# Altium project ESP32IOTProduct.PrjPcb (part 6 of 6)

## Sheet GSM_Sheet.SchDoc
size 420 x 297 mm; DocumentNumber: 5; SheetNumber: 5; SheetTotal: 10
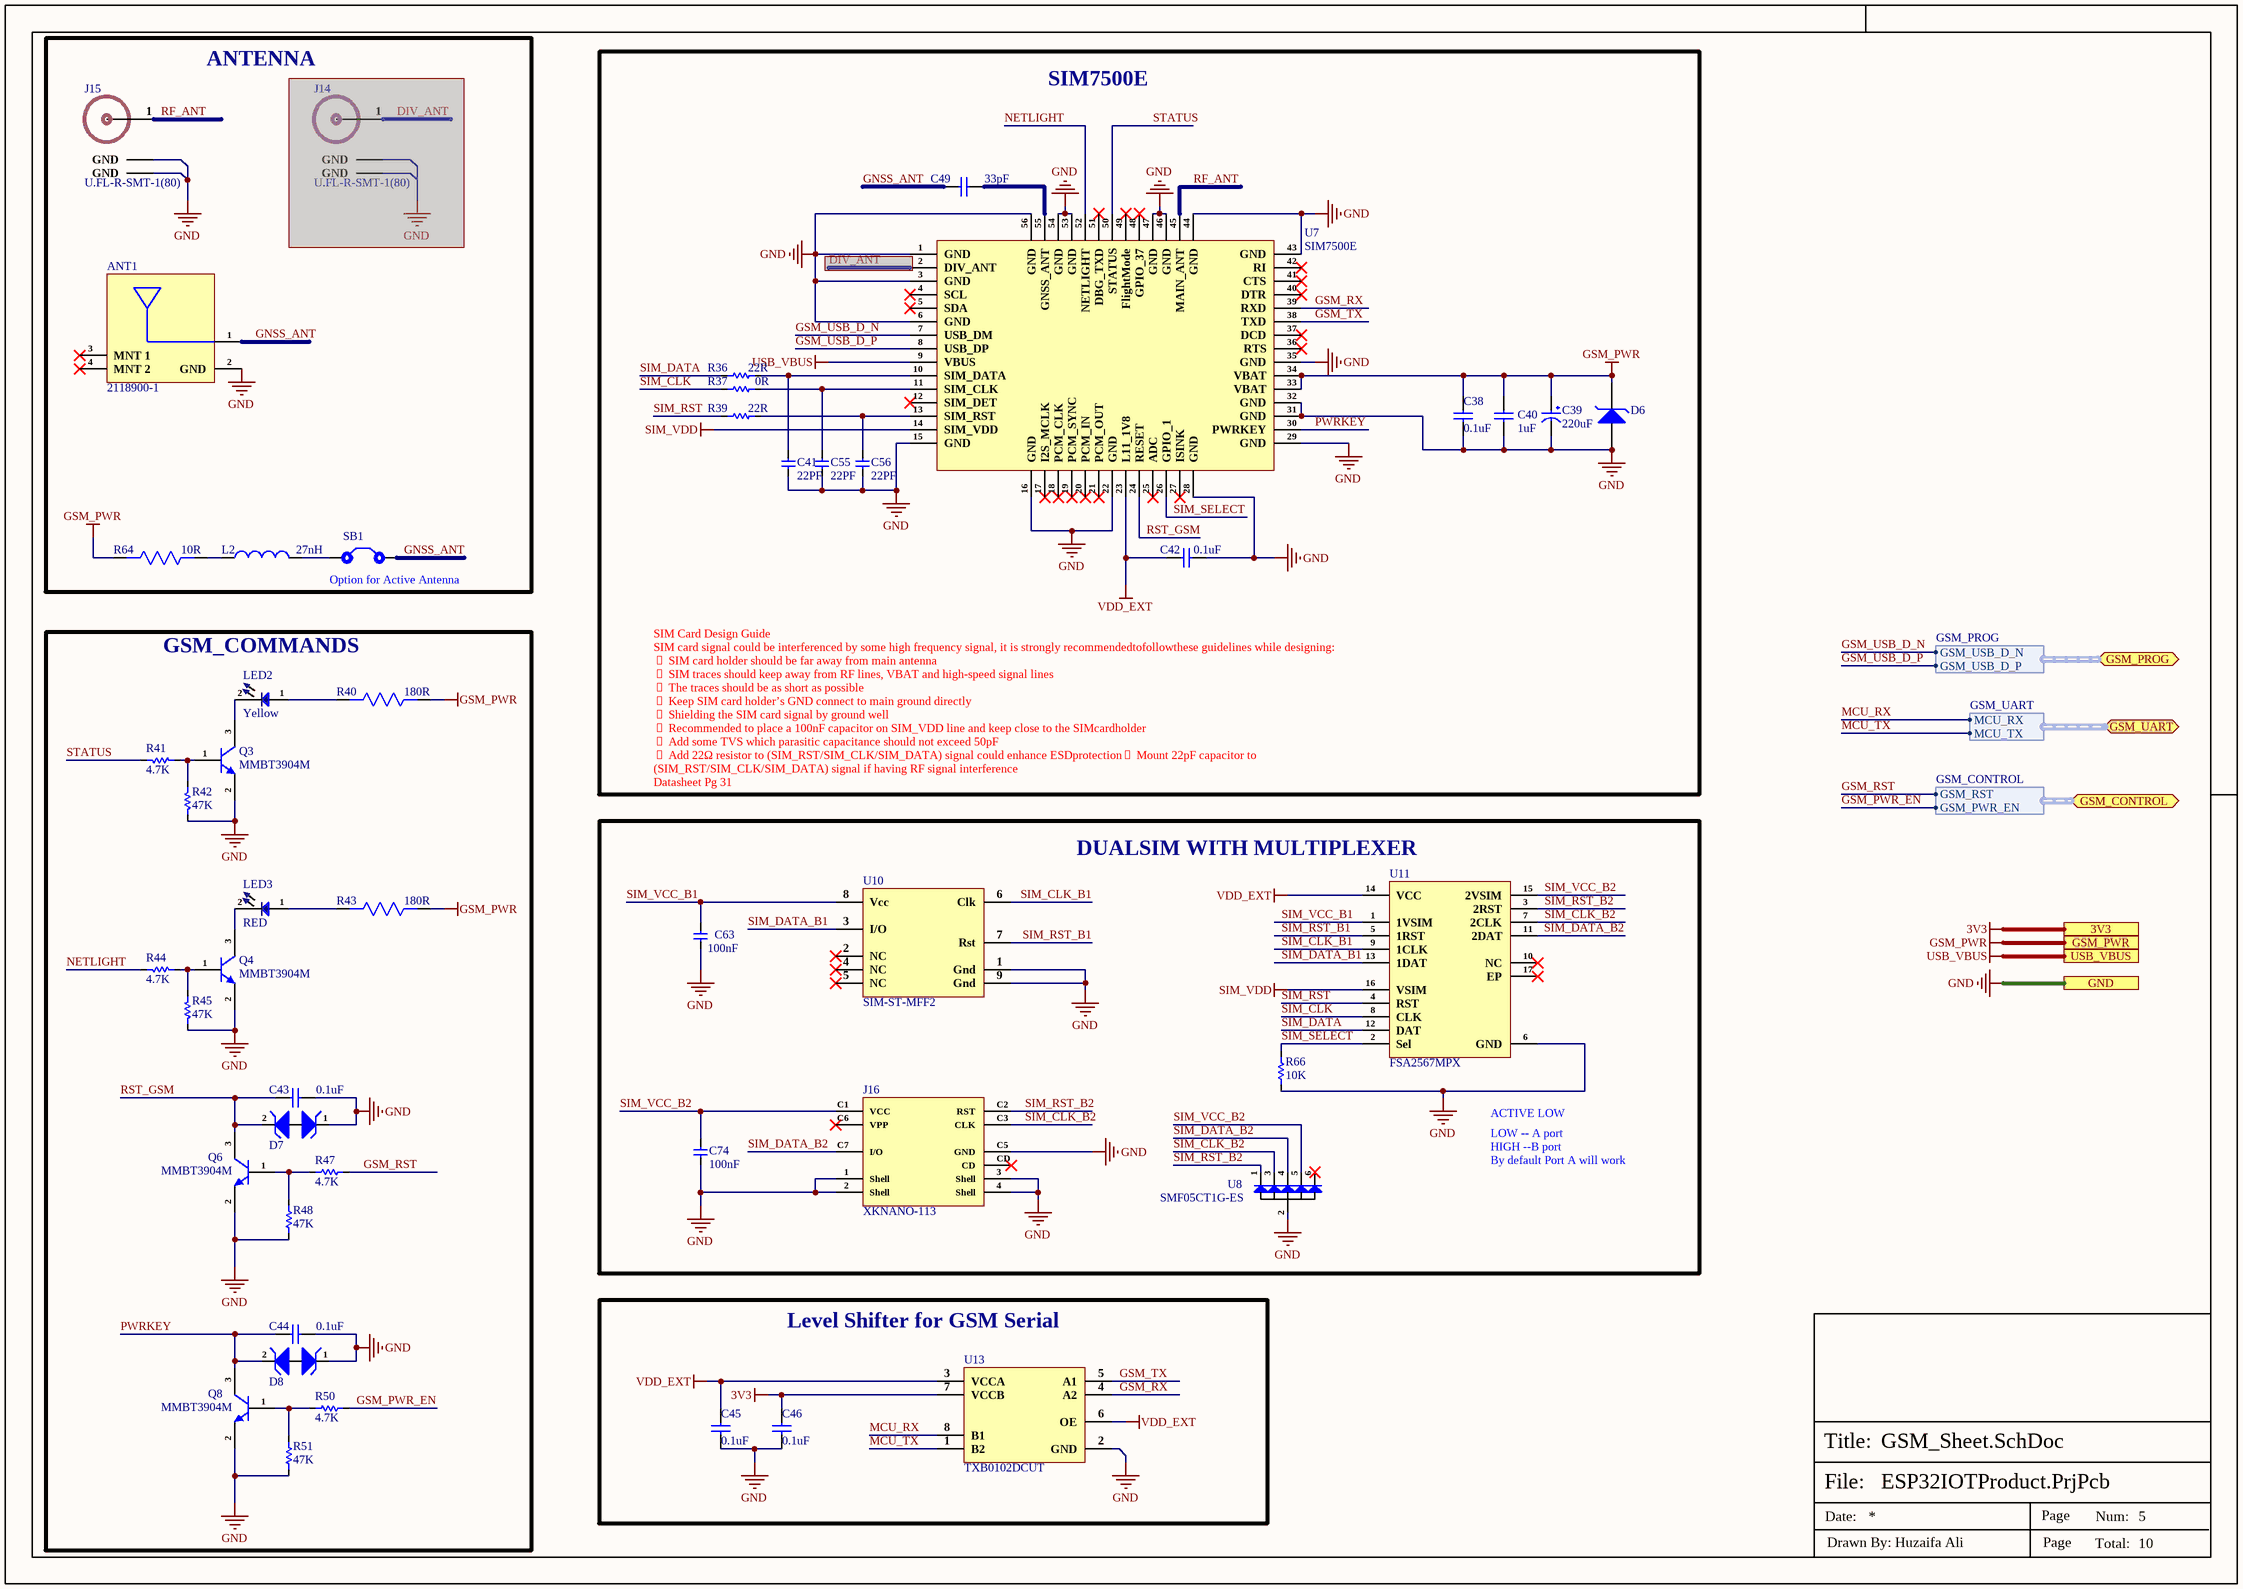
[diagram p9: GSM_Sheet.SchDoc]

### Parts
(Parts that share a designator on the sheet are numbered #1, #2 ... from top to bottom, then left to right.)
ANT1  2118900-1  [2118900-1]
C38  0.1uF  [Cap-0603]
C39  220uF  [UCD-220uF-10mmDia]
C40  1uF  [Cap-0603]
C41  22PF  [Cap-0402]
C42  0.1uF  [Cap-0603]
C43  0.1uF  [Cap-0603]
C44  0.1uF  [Cap-0603]
C45  0.1uF  [Cap-0603]
C46  0.1uF  [Cap-0603]
C49  33pF  [Cap-0402]
C55#2  22PF  [Cap-0402]
C56#2  22PF  [Cap-0402]
C63#2  100nF  [cap-0402]
C74  100nF  [cap-0402]
D6  MMSZ5231BT1G  [SOD-123]  (value not drawn)
D7  ESD5651N-2/TR  [DFN1006-2L_]  (value not drawn)
D8  ESD5651N-2/TR  [DFN1006-2L_]  (value not drawn)
J14  U.FL-R-SMT-1(80)  [U.FL-R-SMT-1(80)_]  (masked out: inside a compile mask, not in the netlist)
J15  U.FL-R-SMT-1(80)  [U.FL-R-SMT-1(80)_]
J16  XKNANO-113  [XKNANO-113]
L2  27nH  [IND-0603 (1608 Metric)]
LED2  Yellow  [LED-0603]
LED3  RED  [LED-0603]
Q3  MMBT3904M  [SOT-723]
Q4  MMBT3904M  [SOT-723]
Q6  MMBT3904M  [SOT-723]
Q8  MMBT3904M  [SOT-723]
R36  22R  [Res-0603]
R37  0R  [Res-0603]
R39  22R  [Res-0603]
R40  180R  [Res-0603]
R41  4.7K  [Res-0603]
R42  47K  [Res-0603]
R43  180R  [Res-0603]
R44  4.7K  [Res-0603]
R45  47K  [Res-0603]
R47  4.7K  [Res-0603]
R48  47K  [Res-0603]
R50  4.7K  [Res-0603]
R51  47K  [Res-0603]
R64  10R  [Res-0603]
R66  10K  [Res-0603]
SB1  Solder Bridge 0603  [Solder Bridge]  (value not drawn)
U7  SIM7500E  [SIM7500E]
U8  SMF05CT1G-ES  [SOT-363]
U10  SIM-ST-MFF2  [QNF8 (6 x 5mm)]
U11  FSA2567MPX  [16-MLP (3x3)]
U13  TXB0102DCUT  [VSSOP-8(2x2.3x0.5)]

### Blocks framed on the sheet
ANTENNA: ANT1 J14 J15 L2 R64 SB1
SIM7500E: C38-C42 C49 C55#2 C56#2 D6 R36 R37 R39 U7
GSM_COMMANDS: C43 C44 D7 D8 LED2 LED3 Q3 Q4 Q6 Q8 R40-R45 R47 R48 R50 R51
DUALSIM WITH MULTIPLEXER: C63#2 C74 J16 R66 U8 U10 U11
Level Shifter for GSM Serial: C45 C46 U13

### Ports
3V3, GND, GSM_CONTROL (bidir, harness GSM_CONTROL), GSM_PROG (bidir, harness GSM_PROG), GSM_PWR, GSM_UART (bidir, harness GSM_UART), USB_VBUS

### Harnesses
GSM_PROG: GSM_USB_D_N, GSM_USB_D_P
GSM_UART: MCU_RX, MCU_TX
GSM_CONTROL: GSM_RST, GSM_PWR_EN

### Nets
3V3: C46.2 U13.7(VCCB) ; port 3V3
GND: ANT1.2(GND) C38.1 C39.2 C40.2 C41.1 C42.1 C43.1 C44.1 C45.1 C46.1 C55#2.1 C56#2.1 C63#2.1 C74.1 D6.1(A) D7.1 D8.1 J15.2(GND) J15.3(GND) J16.1(Shell) J16.2(Shell) J16.3(Shell) J16.4(Shell) J16.C5(GND) Q3.2(E) Q4.2(E) Q6.2(E) Q8.2(E) R42.1 R45.1 R48.1 R51.1 R66.2 U7.1(GND) U7.3(GND) U7.6(GND) U7.15(GND) U7.16(GND) U7.22(GND) U7.28(GND) U7.29(GND) U7.31(GND) U7.32(GND) U7.35(GND) U7.43(GND) U7.44(GND) U7.46(GND) U7.47(GND) U7.53(GND) U7.54(GND) U7.56(GND) U8.2(A) U10.1(Gnd) U10.9(Gnd) U11.6(GND) U13.2(GND) ; port GND
GSM_PWR: C38.2 C39.1 C40.1 D6.2(K) R40.1 R43.1 R64.2 U7.33(VBAT) U7.34(VBAT) ; port GSM_PWR
SIM_VDD: U7.14(SIM_VDD) U11.16(VSIM)
USB_VBUS: U7.9(VBUS) ; port USB_VBUS
VDD_EXT: C42.2 C45.2 U7.23(L11_1V8) U11.14(VCC) U13.3(VCCA) U13.6(OE)
GNSS_ANT: ANT1.1 C49.2 SB1.2
GSM_PWR_EN: R50.1 ; port GSM_CONTROL.GSM_PWR_EN
GSM_RST: R47.1 ; port GSM_CONTROL.GSM_RST
GSM_RX: U7.39(RXD) U13.4(A2)
GSM_TX: U7.38(TXD) U13.5(A1)
GSM_USB_D_N: U7.7(USB_DM) ; port GSM_PROG.GSM_USB_D_N  [project net GSM_PROG.GSM_USB_D_N]
GSM_USB_D_P: U7.8(USB_DP) ; port GSM_PROG.GSM_USB_D_P  [project net GSM_PROG.GSM_USB_D_P]
MCU_RX: U13.8(B1) ; port GSM_UART.MCU_RX
MCU_TX: U13.1(B2) ; port GSM_UART.MCU_TX
NETLIGHT: R44.1 U7.52(NETLIGHT)
PWRKEY: C44.2 D8.2 Q8.3(C) U7.30(PWRKEY)
RF_ANT: J15.1(RF_IN) U7.45(MAIN_ANT)
RST_GSM: C43.2 D7.2 Q6.3(C) U7.24(RESET)
SIM_CLK: R37.2 U11.8(CLK)
SIM_CLK_B1: U10.6(Clk) U11.9(1CLK)
SIM_CLK_B2: J16.C3(CLK) U8.3(IO2) U11.7(2CLK)
SIM_DATA: R36.1 U11.12(DAT)
SIM_DATA_B1: U10.3(I/O) U11.13(1DAT)
SIM_DATA_B2: J16.C7(I/O) U8.4(IO3) U11.11(2DAT)
SIM_RST: R39.1 U11.4(RST)
SIM_RST_B1: U10.7(Rst) U11.5(1RST)
SIM_RST_B2: J16.C2(RST) U8.1(IO1) U11.3(2RST)
SIM_SELECT: R66.1 U7.26(GPIO_1) U11.2(Sel)
SIM_VCC_B1: C63#2.2 U10.8(Vcc) U11.1(1VSIM)
SIM_VCC_B2: C74.2 J16.C1(VCC) U8.5(IO4) U11.15(2VSIM)
STATUS: R41.1 U7.50(STATUS)
NetC41_2: C41.2 R36.2 U7.10(SIM_DATA)
NetC49_1: C49.1 U7.55(GNSS_ANT)
NetC55#2_2: C55#2.2 R37.1 U7.11(SIM_CLK)
NetC56#2_2: C56#2.2 R39.2 U7.13(SIM_RST)
NetL2_1: L2.1 R64.1
NetL2_2: L2.2 SB1.1
NetLED2_1: LED2.1 R40.2
NetLED2_2: LED2.2 Q3.3(C)
NetLED3_1: LED3.1 R43.2
NetLED3_2: LED3.2 Q4.3(C)
NetQ3_1: Q3.1(B) R41.2 R42.2
NetQ4_1: Q4.1(B) R44.2 R45.2
NetQ6_1: Q6.1(B) R47.2 R48.2
NetQ8_1: Q8.1(B) R50.2 R51.2

Not connected (* = marked no-connect by the designer): ANT1 3(MNT_1)* 4(MNT_2)*; J16 C6(VPP)* CD*; U7 2(DIV_ANT) 4(SCL)* 5(SDA)* 12(SIM_DET)* 17(I2S_MCLK)* 18(PCM_CLK)* 19(PCM_SYNC)* 20(PCM_IN)* 21(PCM_OUT)* 25(ADC)* 27(ISINK)* 36(RTS)* 37(DCD)* 40(DTR)* 41(CTS)* 42(RI)* 48(GPIO_37)* 49(FlightMode)* 51(DBG_TXD)*; U8 6(IO5)*; U10 2(NC)* 4(NC)* 5(NC)*; U11 10(NC)* 17(EP)*

### Notes on the sheet
- (near SB1) Option for Active Antenna
- SIM Card Design Guide
  SIM card signal could be interferenced by some high frequency signal, it is strongly recommendedtofollowthese guidelines while designing:
   SIM card holder should be far away from main antenna
   SIM traces should keep away from RF lines, VBAT and high-speed signal lines
   The traces should be as short as possible
   Keep SIM card holder’s GND connect to main ground directly
   Shielding the SIM card signal by ground well
   Recommended to place a 100nF capacitor on SIM_VDD line and keep close to the SIMcardholder
   Add some TVS which parasitic capacitance should not exceed 50pF
   Add 22Ω resistor to (SIM_RST/SIM_CLK/SIM_DATA) signal could enhance ESDprotection Mount 22pF capacitor to (SIM_RST/SIM_CLK/SIM_DATA) signal if having RF signal interference
  Datasheet Pg 31
- ACTIVE LOW
- LOW -- A port
  HIGH --B port
- By default Port A will work
- File:
- Title:
- Date:
- Page
- Num:
- Total:
- Drawn By: Huzaifa Ali

### Library data of the parts
ANT1 = 2118900-1: Standard GNSS Antenna Linear 50Ohm 1602MHz Surface Mount; Manufacturer: TE Connectivity; VSWR: 2; Number of Bands: 1; Max Power Dissipation: 3W; Supplier 1: Arrow Electronics; Manufacturer Part Number: 2118900-1; RoHS: Yes; Category: RF Antennas; Stock 1: 449; Pricing 1: 1=0.6707, 10=0.6495, 25=0.6314, 100=0.5857, 250=0.5691 (USD); Mounting Technology: Surface Mount; Series: -; RoHS Compliant: Yes; ComponentLink1URL: https://www.te.com/commerce/DocumentDelivery/DDEController?Action=srchrtrv&amp;DocNm=1-1773969-5-GNSS-2118900-1-ant-datasheet&amp;DocType=DS&amp;DocLang=English&src-supplier=Digi-Key; ComponentLink1Description: https://www.te.com/commerce/DocumentDelivery/DDEController?Action=srchrtrv&amp;DocNm=1-1773969-5-GNSS-2118900-1-ant-datasheet&amp;DocType=DS&amp;DocLang=English&src-supplier=Digi-Key; Supplier Part Number 1: 2118900-1; Item Type: Antenna
C38 C42-C46 = CC0603KRX5R9BB104: CAP CER 0.1UF 50V X5R 0603; Manufacturer: Yageo; Capacitance: 100nF; Tolerance: 10%; Item Type: Capacitor; Supplier 1: Digi-Key; Manufacturer Part Number: CC0603KRX5R9BB104; RoHS: Yes; Category: Ceramic Capacitors; Stock 1: 152253; Pricing 1: 1=0.10000, 10=0.05200, 50=0.02820, 100=0.02310, 500=0.01648, 1000=0.01294 (USD); Mount: Surface Mount; Case/Package: 0603; Case Code (Imperial): 0603; Case Code (Metric): 1608; Weight: 7.1E-05oz; Min Operating Temperature: -55°C; Max Operating Temperature: 85°C; Packaging: Tape and Reel; Voltage Rating: 50V; Dielectric: X5R; Termination: SMD/SMT; Voltage Rating (DC): 50V; Package Quantity: 4000; Length: 0.063inch; Width: 0.031inch; Thickness: 0.035inch; Lead Free: Lead Free; Halogen Free: Halogen Free; ComponentLink1URL: http://www.mouser.com/ds/2/447/Yageo_UPY-GP_NP0_16V-to-50V_9-358835.pdf?src-supplier=Mouser; ComponentLink1Description: http://www.mouser.com/ds/2/447/Yageo_UPY-GP_NP0_16V-to-50V_9-358835.pdf?src-supplier=Mouser; ComponentLink2URL: https://www.yageo.com/upload/media/product/productsearch/datasheet/mlcc/UPY-GPHC_X5R_4V-to-50V_26.pdf?src-supplier=Digi-Key; ComponentLink2Description: https://www.yageo.com/upload/media/product/productsearch/datasheet/mlcc/UPY-GPHC_X5R_4V-to-50V_26.pdf?src-supplier=Digi-Key; ComponentLink3URL: http://www.yageo.com/exep/pages/download/literatures/ProductSelectionGuide%202014_Final_2.pdf?src-supplier=Digi-Key; ComponentLink3Description: http://www.yageo.com/exep/pages/download/literatures/ProductSelectionGuide%202014_Final_2.pdf?src-supplier=Digi-Key; Supplier Part Number 1: 311-4046-1-ND; LCSC Part Number: C110022
C39 = UCD1H221MNL1GS: CAP ALUM 220UF 20% 50V SMD; Manufacturer: Nichicon; Ripple Current: 700mA; Impedance: 160mR; Leakage Current: 3uA; Life (Hours): 5000Hour; Dissipation Factor: 0.1%; Item Type: Capacitor; Supplier 1: Digi-Key; Manufacturer Part Number: UCD1H221MNL1GS; RoHS: Yes; Category: Aluminum Electrolytic Capacitors; Pricing 1: 1=0.85000, 10=0.60200, 50=0.45480, 100=0.39620 (USD); Mount: Surface Mount,PCB; Case/Package: Radial; Min Operating Temperature: -55°C; Max Operating Temperature: 105°C; Capacitance: 220uF; Tolerance: 20%; Voltage Rating: 50V; Packaging: Tape and Reel; Package Quantity: 1; Voltage Rating (DC): 50V; Termination: SMD/SMT; Voltage: 50V; Features: General Purpose; Series: CD; Construction: Cylindrical; Diameter: 10mm; Length: 10mm; Height: 10mm; Height - Seated (Max): 0.394inch; Radiation Hardening: No; Lead Free: Lead Free; RoHS Compliant: Yes; ComponentLink1URL: https://datasheet.ciiva.com/11776/0900766b80ebdadd-11776792.pdf?src-supplier=RSComponents; ComponentLink1Description: https://datasheet.ciiva.com/11776/0900766b80ebdadd-11776792.pdf?src-supplier=RSComponents; ComponentLink2URL: https://datasheet.ciiva.com/5362/e-cd-22158-5362489.pdf?src-supplier=Mouser; ComponentLink2Description: https://datasheet.ciiva.com/5362/e-cd-22158-5362489.pdf?src-supplier=Mouser; ComponentLink3URL: https://datasheet.ciiva.com/11684/e-cd-11684678.pdf?src-supplier=Avnet; ComponentLink3Description: https://datasheet.ciiva.com/11684/e-cd-11684678.pdf?src-supplier=Avnet; ComponentLink4URL: https://datasheet.ciiva.com/15037/e-cd-15037119.pdf?src-supplier=Digi-Key; ComponentLink4Description: https://datasheet.ciiva.com/15037/e-cd-15037119.pdf?src-supplier=Digi-Key; ComponentLink5URL: https://datasheet.ciiva.com/16393/e-cd-16393493.pdf?src-supplier=Future+Electronics; ComponentLink5Description: https://datasheet.ciiva.com/16393/e-cd-16393493.pdf?src-supplier=Future+Electronics; ComponentLink6URL: https://datasheet.ciiva.com/17354/e-cd-17354606.pdf?src-supplier=Avnet+Europe; ComponentLink6Description: https://datasheet.ciiva.com/17354/e-cd-17354606.pdf?src-supplier=Avnet+Europe; Supplier Part Number 1: 493-6390-1-ND; LCSC Part Number: C116211
C40 = CC0603KRX5R8BB105: CAP CER 1UF 25V X5R 0603; Manufacturer: Yageo; Tolerance: 10%; Supplier 1: Digi-Key; Manufacturer Part Number: CC0603KRX5R8BB105; RoHS: Yes; Category: Ceramic Capacitors; Stock 1: 919939; Pricing 1: 1=0.12000, 10=0.08400, 50=0.04760, 100=0.03940, 500=0.02764, 1000=0.02288 (USD); Mount: Surface Mount; Case/Package: 0603; Number of Pins: 2; Case Code (Metric): 1608; Case Code (Imperial): 0603; Min Operating Temperature: -55°C; Max Operating Temperature: 85°C; Capacitance: 1uF; Dielectric: X5R; Package Quantity: 1; Voltage Rating: 25V; Packaging: Tape and Reel; Termination: SMD/SMT; Voltage Rating (DC): 25V; Series: CC; Construction: Flat; Length: 1.6mm; Width: 0.031inch; Height: 0.8mm; Thickness: 0.035inch; Depth: 0.8mm; Radiation Hardening: No; REACH SVHC: No SVHC; Lead Free: Lead Free; Halogen Free: Halogen Free; RoHS Compliant: Yes; ComponentLink1URL: https://datasheet.ciiva.com/176/mlccorderingcode-176785.pdf?src-supplier=Digi-Key; ComponentLink1Description: https://datasheet.ciiva.com/176/mlccorderingcode-176785.pdf?src-supplier=Digi-Key; ComponentLink2URL: https://datasheet.ciiva.com/176/mlccorderingcode-176786.pdf?src-supplier=Digi-Key; ComponentLink2Description: https://datasheet.ciiva.com/176/mlccorderingcode-176786.pdf?src-supplier=Digi-Key; ComponentLink3URL: https://datasheet.ciiva.com/176/mlccorderingcode-176787.pdf?src-supplier=Digi-Key; ComponentLink3Description: https://datasheet.ciiva.com/176/mlccorderingcode-176787.pdf?src-supplier=Digi-Key; ComponentLink4URL: https://datasheet.ciiva.com/17436/upy-gphc-x5r-4v-to-50v-12-17436952.pdf?src-supplier=Avnet+Europe; ComponentLink4Description: https://datasheet.ciiva.com/17436/upy-gphc-x5r-4v-to-50v-12-17436952.pdf?src-supplier=Avnet+Europe; ComponentLink5URL: https://datasheet.ciiva.com/7978/1525783-7978171.pdf?src-supplier=Element14; ComponentLink5Description: https://datasheet.ciiva.com/7978/1525783-7978171.pdf?src-supplier=Element14; ComponentLink6URL: https://datasheet.ciiva.com/11586/upy-gphc-x5r-4v-to-50v-12-11586318.pdf?src-supplier=Avnet; ComponentLink6Description: https://datasheet.ciiva.com/11586/upy-gphc-x5r-4v-to-50v-12-11586318.pdf?src-supplier=Avnet; Supplier Part Number 1: 311-1445-1-ND; LCSC Part Number: C14664
C41 C55#2 C56#2 = CC0402JRNPO9BN220: CAP CER 22PF 50V C0G/NPO 0402; Manufacturer: Yageo; Dielectric Material: Ceramic; Tolerance: 5%; Dielectric: C0G; Temperature Coefficient: 30ppm/°C; Insulation Resistance: 100GR; Item Type: Capacitor; Supplier 1: Future Electronics; Manufacturer Part Number: CC0402JRNPO9BN220; RoHS: Yes; Category: Ceramic Capacitors; Stock 1: 200000; Pricing 1: 10000=0.00220, 40000=0.00210, 150000=0.00200, 400000=0.00190, 1000000=0.00180 (USD); Mounting Technology: Surface Mount; Case/Package: 0402; Pins: 2; Case Code (Metric): 1005; Case Code (Imperial): 0402; Min Operating Temperature: -55°C; Max Operating Temperature: 125°C; Value: 22pF; Voltage Rating: 50V; Packaging: Tape and Reel; Package Quantity: 1; Voltage Rating (DC): 50V; Termination: SMD/SMT; Resistor Type: Ceramic; Voltage: 50V; Series: CC; Length: 1mm; Width: 0.02inch; Height: 0.5mm; Thickness: 0.022inch; Depth: 0.5mm; Radiation Hardening: No; Reach SVHC Compliant: Yes; Lead Free: Lead Free; RoHS Compliant: Yes; ComponentLink1URL: https://datasheet.ciiva.com/5789/1443161-5789509.pdf?src-supplier=Farnell; ComponentLink1Description: https://datasheet.ciiva.com/5789/1443161-5789509.pdf?src-supplier=Farnell; ComponentLink2URL: https://datasheet.ciiva.com/8033/1443161-8033606.pdf?src-supplier=Element14; ComponentLink2Description: https://datasheet.ciiva.com/8033/1443161-8033606.pdf?src-supplier=Element14; ComponentLink3URL: https://datasheet.ciiva.com/7656/1132289-7656615.pdf?src-supplier=Element14; ComponentLink3Description: https://datasheet.ciiva.com/7656/1132289-7656615.pdf?src-supplier=Element14; ComponentLink4URL: https://datasheet.ciiva.com/8033/1443161-8033607.pdf?src-supplier=Element14; ComponentLink4Description: https://datasheet.ciiva.com/8033/1443161-8033607.pdf?src-supplier=Element14; ComponentLink5URL: https://datasheet.ciiva.com/8033/1443161-8033605.pdf?src-supplier=Element14; ComponentLink5Description: https://datasheet.ciiva.com/8033/1443161-8033605.pdf?src-supplier=Element14; ComponentLink6URL: https://datasheet.ciiva.com/143/mlccorderingcode-143987.pdf?src-supplier=Digi-Key; ComponentLink6Description: https://datasheet.ciiva.com/143/mlccorderingcode-143987.pdf?src-supplier=Digi-Key; ComponentLink7URL: https://datasheet.ciiva.com/143/mlccorderingcode-143986.pdf?src-supplier=Digi-Key; ComponentLink7Description: https://datasheet.ciiva.com/143/mlccorderingcode-143986.pdf?src-supplier=Digi-Key; ComponentLink8URL: https://datasheet.ciiva.com/143/mlccorderingcode-143988.pdf?src-supplier=Digi-Key; ComponentLink8Description: https://datasheet.ciiva.com/143/mlccorderingcode-143988.pdf?src-supplier=Digi-Key; ComponentLink9URL: https://datasheet.ciiva.com/5425/upy-gp-np0-16v-to-50v-8-5425483.pdf?src-supplier=Mouser; ComponentLink9Description: https://datasheet.ciiva.com/5425/upy-gp-np0-16v-to-50v-8-5425483.pdf?src-supplier=Mouser; ComponentLink10URL: https://datasheet.ciiva.com/15189/getdatasheetpartid-370074-15189117.pdf?src-supplier=Verical; ComponentLink10Description: https://datasheet.ciiva.com/15189/getdatasheetpartid-370074-15189117.pdf?src-supplier=Verical; Supplier Part Number 1: 9105957; LCSC Part Number: C106203
C49 = GRM1555C1E330JA01D: CAP CER 33PF 25V C0G/NP0 0402; Manufacturer: Murata; Tolerance: 5%; Dielectric: C0G; Supplier 1: Digi-Key; Manufacturer Part Number: GRM1555C1E330JA01D; Stock 1: 250773; Pricing 1: 1=0.1, 10=0.034, 50=0.0184, 100=0.0151, 500=0.01078, 1000=0.00847, 2500=0.0077, 5000=0.00708 (USD); Mount: Surface Mount; Case/Package: 0402; Case Code (Metric): 1005; Case Code (Imperial): 0402; Min Operating Temperature: -55°C; Max Operating Temperature: 125°C; Capacitance: 33pF; Package Quantity: 1; Voltage Rating: 25V; Packaging: Tape and Reel; Voltage Rating (DC): 25V; Termination: SMD/SMT; Voltage: 25V; Series: GRM; Construction: Flat; Length: 1mm; Width: 0.02inch; Height: 0.5mm; Thickness: 0.022inch; Depth: 0.5mm; Radiation Hardening: No; Lead Free: Lead Free; RoHS Compliant: Yes; ComponentLink1URL: https://www.murata.com/~/media/webrenewal/support/library/catalog/products/capacitor/mlcc/c02e.ashx?la=en-us&src-supplier=Digi-Key; ComponentLink1Description: https://www.murata.com/~/media/webrenewal/support/library/catalog/products/capacitor/mlcc/c02e.ashx?la=en-us&src-supplier=Digi-Key; ComponentLink2URL: http://www.mouser.com/ds/2/281/c02e-2905.pdf?src-supplier=Mouser; ComponentLink2Description: http://www.mouser.com/ds/2/281/c02e-2905.pdf?src-supplier=Mouser; ComponentLink3URL: http://psearch.murata.com/capacitor/product/GRM1555C1E330JA01%23.pdf?src-supplier=Avnet; ComponentLink3Description: http://psearch.murata.com/capacitor/product/GRM1555C1E330JA01%23.pdf?src-supplier=Avnet; Supplier Part Number 1: 490-6177-1-ND; LCSC Part Number: C441758
C63#2 C74 = C1005X7R1H104KT000F: CAP CER 0.1UF 50V X7R 0402; Manufacturer: TDK; Tolerance: 10%; Voltage: 25V; Item Type: Capacitor; Supplier 1: Avnet; Manufacturer Part Number: C1005X7R1H104KT000F; RoHS: No; Category: Ceramic Capacitors; Dielectric: X7R; Supplier Part Number 1: C1005X7R1H104KT000F; LCSC Part Number: C361198; ComponentLink1Description: LCSC; ComponentLink1URL: https://www.lcsc.com/product-detail/Multilayer-Ceramic-Capacitors-MLCC-SMD-SMT_TDK-C1005X7R1H104KT000F_C361198.html
D6 = MMSZ5231BT1G: DIODE ZENER 5.1V 500MW SOD123; Manufacturer: ON Semiconductor; Material: Plastic; Max Reverse Leakage Current: 5uA; Impedance: 17R; Tolerance: 5%; Zener Current: 10mA; Test Current: 20mA; Forward Voltage: 900mV; Breakdown Voltage: 5.36V; Supplier 1: Allied Electronics; Manufacturer Part Number: MMSZ5231BT1G; RoHS: Yes; Category: Zener Diodes; Case/Package: SOD-123-2; Pins: 2; Min Operating Temperature: -55°C; Max Operating Temperature: 150°C; Max Power Dissipation: 500mW; Packaging: Tape and Reel; Zener Voltage: 5.1V; Package Quantity: 3000; Series: Automotive, AEC-Q101; Voltage Tolerance: 5%; Power Dissipation: 500mW; Working Voltage: 5.1V; Max Reverse Current: 5uA; Voltage Rating (DC): 5.1V; Power Rating: 500mW; Length: 2.69mm; Width: 1.6mm; Height: 1.12mm; RoHS Compliant: Yes; Lead Free: Lead Free; Reach SVHC Compliant: No; ComponentLink1URL: https://datasheet.ciiva.com/23815/1708301-23815376.pdf?src-supplier=Newark; ComponentLink1Description: https://datasheet.ciiva.com/23815/1708301-23815376.pdf?src-supplier=Newark; ComponentLink2URL: https://datasheet.ciiva.com/22626/1708301-22626967.pdf?src-supplier=Element14; ComponentLink2Description: https://datasheet.ciiva.com/22626/1708301-22626967.pdf?src-supplier=Element14; ComponentLink3URL: https://datasheet.ciiva.com/4731/mmsz5221bt1-d-4731452.pdf?src-supplier=Mouser; ComponentLink3Description: https://datasheet.ciiva.com/4731/mmsz5221bt1-d-4731452.pdf?src-supplier=Mouser; ComponentLink4URL: https://datasheet.ciiva.com/16200/mmsz5221bt1-d-16200104.pdf?src-supplier=Future+Electronics; ComponentLink4Description: https://datasheet.ciiva.com/16200/mmsz5221bt1-d-16200104.pdf?src-supplier=Future+Electronics; ComponentLink5URL: https://datasheet.ciiva.com/894/mmsz5221bt1-d-894882.pdf?src-supplier=Digi-Key; ComponentLink5Description: https://datasheet.ciiva.com/894/mmsz5221bt1-d-894882.pdf?src-supplier=Digi-Key; ComponentLink6URL: https://datasheet.ciiva.com/894/mmsz5221bt1-d-894883.pdf?src-supplier=Digi-Key; ComponentLink6Description: https://datasheet.ciiva.com/894/mmsz5221bt1-d-894883.pdf?src-supplier=Digi-Key; ComponentLink7URL: https://datasheet.ciiva.com/894/mmsz5221bt1-d-894881.pdf?src-supplier=Digi-Key; ComponentLink7Description: https://datasheet.ciiva.com/894/mmsz5221bt1-d-894881.pdf?src-supplier=Digi-Key; Supplier Part Number 1: 70099546; LCSC Part Number: C66198; Item Type: Diode
D7 D8 = ESD5651N-2/TR: 35A@8/20us 15V 4.5V@Max Unidirectional DFN1006 TVS ROHS; Manufacturer: WILLSEMI(Will Semicon); Item Type: Diode; Manufacturer Part Number: ESD5651N-2/TR; Package: DFN1006; LCSC Part Number: C239784; ComponentLink1Description: LCSC; ComponentLink1URL: https://www.lcsc.com/product-detail/TVS_WILLSEMI-Will-Semicon-ESD5651N-2-TR_C239784.html
J14 J15 = U.FL-R-SMT-1(80): CONN U.FL RCPT STR 50 OHM SMD; Manufacturer: Hirose; Supplier 1: Future Electronics; Manufacturer Part Number: U.FL-R-SMT-1(80); Stock 1: 1272; Pricing 1: 1=1.07, 500=0.785, 1500=0.74, 2500=0.72, 5000=0.695 (USD); Case/Package: SMD/SMT; Package Quantity: 10000; Packaging: Tape and Reel; Lead Free: Lead Free; ComponentLink1URL: https://www.hirose.com/product/en/download_file/key_name/U.FL-R-SMT-1%2880%29/category/Specification%20Sheet/doc_file_id/37638/?file_category_id=9&item_id=03310472280&is_series=&src-supplier=Digi-Key; ComponentLink1Description: https://www.hirose.com/product/en/download_file/key_name/U.FL-R-SMT-1%2880%29/category/Specification%20Sheet/doc_file_id/37638/?file_category_id=9&item_id=03310472280&is_series=&src-supplier=Digi-Key; ComponentLink2URL: http://www.mouser.com/ds/2/185/U.FL_catalog-939761.pdf?src-supplier=Mouser; ComponentLink2Description: http://www.mouser.com/ds/2/185/U.FL_catalog-939761.pdf?src-supplier=Mouser; Supplier Part Number 1: U.FL-R-SMT-1(80)-CUTT; LCSC Part Number: C88374
J16 = XKNANO-113: Copper Alloy Self bomb Gold plating 1.25mm Deck -40℃~+85℃ 260℃ NanoSIM SMD SIM Card Connectors ROHS; Manufacturer: XKB Connectivity; Manufacturer Part Number: XKNANO-113; Package: SMD Custom; LCSC Part Number: C381071; Item Type: SIM Card Connectors; ComponentLink1Description: LCSC; ComponentLink1URL: https://www.lcsc.com/product-detail/SIM-Card-Connectors_XKB-Connectivity-XKNANO-113_C381071.html
L2 = LQW18AN27NG10D: FIXED IND 27NH 590MA 116MOHM SMD; Manufacturer: Murata; Core Material: Non-Magnetic; Tolerance: 2%; DC Resistance (DCR): 116mR; Shielding: Unshielded; Self Resonant Frequency: 2.8GHz; Q Factor: 42; Test Frequency: 100MHz; Item Type: Inductor; Supplier 1: Arrow Electronics; Manufacturer Part Number: LQW18AN27NG10D; RoHS: Yes; Category: Fixed Inductors; Stock 1: 3528; Pricing 1: 1=0.17550, 10=0.13260, 25=0.13120, 100=0.10470, 250=0.09530, 500=0.08580, 1000=0.07160, 3000=0.06500 (USD); Mount: Surface Mount; Case/Package: 0603; Weight: 0.000106oz; Case Code (Metric): 1608; Case Code (Imperial): 0603; Min Operating Temperature: -55°C; Max Operating Temperature: 125°C; Inductance: 27nH; Packaging: Tape and Reel; Max DC Current: 590mA; Inductance Tolerance: 2%; Package Quantity: 1; Current Rating: 590mA; Resistor Type: Wirewound; Termination: SMD/SMT; DC Current: 590mA; Series: LQW18A_10; Length: 1.6mm; Width: 0.031inch; Height: 0.8mm; Depth: 1.1mm; Height - Seated (Max): 0.039inch; Radiation Hardening: No; Lead Free: Lead Free; Military Standard: Not; Reach SVHC Compliant: Yes; RoHS Compliant: Yes; ComponentLink1URL: https://datasheet.ciiva.com/11799/0900766b80a002db-11799175.pdf?src-supplier=RSComponents; ComponentLink1Description: https://datasheet.ciiva.com/11799/0900766b80a002db-11799175.pdf?src-supplier=RSComponents; ComponentLink2URL: https://datasheet.ciiva.com/6705/l0075s0080lqw18a-10-6705574.pdf?src-supplier=Digi-Key; ComponentLink2Description: https://datasheet.ciiva.com/6705/l0075s0080lqw18a-10-6705574.pdf?src-supplier=Digi-Key; ComponentLink3URL: https://datasheet.ciiva.com/8507/l0075s0080lqw18a-10-8507510.pdf?src-supplier=Avnet; ComponentLink3Description: https://datasheet.ciiva.com/8507/l0075s0080lqw18a-10-8507510.pdf?src-supplier=Avnet; ComponentLink4URL: https://datasheet.ciiva.com/4978/product-4978252.pdf?src-supplier=Mouser; ComponentLink4Description: https://datasheet.ciiva.com/4978/product-4978252.pdf?src-supplier=Mouser; Supplier Part Number 1: LQW18AN27NG10D; LCSC Part Number: C701182
LED2 = 19-21/G6C-FM1N2B/3T: Yellow-Green 572nm LED Indication - Discrete 2.05V 0603 (1608 Metric); Manufacturer: Everlight Elec; Manufacturer Part Number: 19-21/G6C-FM1N2B/3T; Package: 0603; LCSC Part Number: C93689; Item Type: LED; ComponentLink1Description: LCSC; ComponentLink1URL: https://www.lcsc.com/product-detail/Light-Emitting-Diodes-LED_Everlight-Elec-19-21-G6C-FM1N2B-3T_C93689.html
LED3 = 19-21/R7C-AK1L2BY/3T: Red 632nm LED Indication - Discrete 2.05V 0603 (1608 Metric); Manufacturer: Everlight Elec; Manufacturer Part Number: 19-21/R7C-AK1L2BY/3T; Package: 0603; LCSC Part Number: C1322287; Item Type: LED; ComponentLink1Description: LCSC; ComponentLink1URL: https://www.lcsc.com/product-detail/Light-Emitting-Diodes-LED_Everlight-Elec-19-21-R7C-AK1L2BY-3T_C1322287.html
Q3 Q4 Q6 Q8 = MMBT3904M: 40V 100mW 100@10mA,1V 200mA 300MHz 300mV@50mA,5mA NPN -55℃~+150℃@(Tj) SOT-723 Bipolar Transistors - BJT ROHS; Manufacturer: TECH PUBLIC; Item Type: Mosfet; ComponentLink1Description: LCSC; ComponentLink1URL: https://www.lcsc.com/product-detail/Bipolar-Transistors-BJT_TECH-PUBLIC-MMBT3904M_C2923360.html; Manufacturer Part Number: MMBT3904M; Package: SOT-723; LCSC Part Number: C2923360
R36 R39 = RC0603FR-0722RL: RES 22 OHM 1% 1/10W 0603; Manufacturer: Yageo; Temperature Coefficient: 100ppm/°C; Voltage Rating (DC): 50V; Power Rating: 100mW; Item Type: Resistor; Supplier 1: Avnet; Manufacturer Part Number: RC0603FR-0722RL; RoHS: Yes; Category: Chip SMD Resistors; Stock 1: 190000; Pricing 1: 5000=0.00133, 10000=0.00131, 20000=0.00127 (USD); Case/Package: 0603; Number of Pins: 2; Case Code (Metric): 1608; Case Code (Imperial): 0603; Size Code: 0603; Min Operating Temperature: -55°C; Max Operating Temperature: 155°C; Tolerance: 1%; Resistance: 22R; Resistor Type: Thick Film; Packaging: Tape and Reel; Voltage Rating: 50V; Package Quantity: 1; Number of Terminations: 2; Termination: SMD/SMT; Max Power Dissipation: 100mW; Features: Moisture Resistant; Series: RC; Resistance Tolerance: 1%; Technology: THICK FILM; Construction: Rectangular; Length: 0.063inch; Width: 0.031inch; Height: 0.022inch; Depth: 0.8mm; Reach SVHC Compliant: Yes; Lead Free: Lead Free; Military Standard: Not; RoHS Compliant: Yes; ComponentLink1URL: https://datasheet.ciiva.com/11819/0900766b80f96399-11819285.pdf?src-supplier=RSComponents; ComponentLink1Description: https://datasheet.ciiva.com/11819/0900766b80f96399-11819285.pdf?src-supplier=RSComponents; ComponentLink2URL: https://datasheet.ciiva.com/46395/443971-46395032.pdf?src-supplier=Element14; ComponentLink2Description: https://datasheet.ciiva.com/46395/443971-46395032.pdf?src-supplier=Element14; ComponentLink3URL: https://datasheet.ciiva.com/46440/1868787-46440901.pdf?src-supplier=Element14; ComponentLink3Description: https://datasheet.ciiva.com/46440/1868787-46440901.pdf?src-supplier=Element14; ComponentLink4URL: https://datasheet.ciiva.com/2454/pyu-r-int-thick-7-2454355.pdf?src-supplier=Digi-Key; ComponentLink4Description: https://datasheet.ciiva.com/2454/pyu-r-int-thick-7-2454355.pdf?src-supplier=Digi-Key; ComponentLink5URL: https://datasheet.ciiva.com/2454/pyu-r-int-thick-7-2454356.pdf?src-supplier=Digi-Key; ComponentLink5Description: https://datasheet.ciiva.com/2454/pyu-r-int-thick-7-2454356.pdf?src-supplier=Digi-Key; ComponentLink6URL: https://datasheet.ciiva.com/2454/pyu-r-int-thick-7-2454354.pdf?src-supplier=Digi-Key; ComponentLink6Description: https://datasheet.ciiva.com/2454/pyu-r-int-thick-7-2454354.pdf?src-supplier=Digi-Key; Supplier Part Number 1: RC0603FR-0722RL; LCSC Part Number: C107701
R37 = RC0603FR-070RL: RES SMD 0R, 1%, 0.1W, 0603; Manufacturer: Yageo; Item Type: Resistor; Manufacturer Part Number: RC0603FR-070RL; Package: 0603; LCSC Part Number: C100044; ComponentLink9Description: LCSC; ComponentLink9URL: https://www.lcsc.com/product-detail/Chip-Resistor-Surface-Mount_YAGEO-RC0603FR-070RL_C100044.html
R40 R43 = RC0603FR-07180RL: RES 180 OHM 1% 1/10W 0603; Manufacturer: Yageo; Power Rating: 100mW; Voltage Rating (DC): 50V; Temperature Coefficient: 100ppm/°C; Item Type: Resistor; Supplier 1: Avnet; Manufacturer Part Number: RC0603FR-07180RL; RoHS: Yes; Category: Chip SMD Resistors; Stock 1: 35000; Pricing 1: 5000=0.00133, 10000=0.00131, 20000=0.00127 (USD); Case/Package: 0603; Number of Pins: 2; Case Code (Metric): 1608; Case Code (Imperial): 0603; Size Code: 0603; Min Operating Temperature: -55°C; Max Operating Temperature: 155°C; Tolerance: 1%; Resistance: 180R; Packaging: Tape and Reel; Package Quantity: 1; Voltage Rating: 50V; Resistor Type: Thick Film; Number of Terminations: 2; Termination: SMD/SMT; Max Power Dissipation: 100mW; Features: Moisture Resistant; Series: RC; Construction: Rectangular; Resistance Tolerance: 1%; Length: 1.6mm; Width: 0.8mm; Height: 0.022inch; Depth: 0.8mm; Lead Free: Lead Free; Military Standard: Not; RoHS Compliant: Yes; ComponentLink1URL: https://datasheet.ciiva.com/2454/pyu-r-int-thick-7-2454469.pdf?src-supplier=Digi-Key; ComponentLink1Description: https://datasheet.ciiva.com/2454/pyu-r-int-thick-7-2454469.pdf?src-supplier=Digi-Key; ComponentLink2URL: https://datasheet.ciiva.com/2454/pyu-r-int-thick-7-2454470.pdf?src-supplier=Digi-Key; ComponentLink2Description: https://datasheet.ciiva.com/2454/pyu-r-int-thick-7-2454470.pdf?src-supplier=Digi-Key; ComponentLink3URL: https://datasheet.ciiva.com/2454/pyu-r-int-thick-7-2454468.pdf?src-supplier=Digi-Key; ComponentLink3Description: https://datasheet.ciiva.com/2454/pyu-r-int-thick-7-2454468.pdf?src-supplier=Digi-Key; ComponentLink4URL: https://datasheet.ciiva.com/7746/443971-7746267.pdf?src-supplier=Element14; ComponentLink4Description: https://datasheet.ciiva.com/7746/443971-7746267.pdf?src-supplier=Element14; ComponentLink5URL: https://datasheet.ciiva.com/7746/443971-7746266.pdf?src-supplier=Element14; ComponentLink5Description: https://datasheet.ciiva.com/7746/443971-7746266.pdf?src-supplier=Element14; ComponentLink6URL: https://datasheet.ciiva.com/15189/getdatasheetpartid-325160-15189622.pdf?src-supplier=Verical; ComponentLink6Description: https://datasheet.ciiva.com/15189/getdatasheetpartid-325160-15189622.pdf?src-supplier=Verical; Supplier Part Number 1: RC0603FR-07180RL; LCSC Part Number: C137786
R41 R44 R47 R50 = RC0603JR-074K7L: RES SMD 4.7K OHM 5% 1/10W 0603; Manufacturer: Yageo; Resistance: 4.7kR; Temperature Coefficient: 100ppm/°C; Voltage Rating (DC): 50V; Power Rating: 100mW; Item Type: Resistor; Supplier 1: Digi-Key; Manufacturer Part Number: RC0603JR-074K7L; Stock 1: 19706643; Pricing 1: 1=0.1, 10=0.02, 100=0.0081, 1000=0.00362, 2500=0.00314 (USD); Case/Package: 0603; Number of Pins: 2; Case Code (Imperial): 0603; Case Code (Metric): 1608; Min Operating Temperature: -55°C; Max Operating Temperature: 155°C; Tolerance: 5%; Composition: Thick Film; Packaging: Tape and Reel; Voltage Rating: 50V; Termination: SMD/SMT; Military Standard: Not; Length: 1.6mm; Width: 0.8mm; Depth: 0.8mm; REACH SVHC: No SVHC; Lead Free: Lead Free; ComponentLink1URL: http://www.farnell.com/datasheets/443971.pdf?src-supplier=Element14; ComponentLink1Description: http://www.farnell.com/datasheets/443971.pdf?src-supplier=Element14; Supplier Part Number 1: 311-4.7KGRCT-ND; LCSC Part Number: C105428
R42 R45 R48 R51 = RC0603JR-0747KL: RES 47K OHM 5% 1/10W 0603; Manufacturer: Yageo; Resistance: 47kR; Power Rating: 100mW; Voltage Rating (DC): 50V; Temperature Coefficient: 100ppm/°C; Resistance Tolerance: 1%; Supplier 1: Arrow; Manufacturer Part Number: RC0603JR-0747KL; Stock 1: 599135; Pricing 1: 5000=0.0025, 10000=0.0022, 25000=0.0019, 1=0.0011, 6000=0.001 (USD); Case/Package: 0603; Number of Pins: 2; Case Code (Imperial): 0603; Case Code (Metric): 1608; Min Operating Temperature: -55°C; Max Operating Temperature: 155°C; Packaging: Tape and Reel; Tolerance: 5%; Voltage Rating: 50V; Package Quantity: 5000; Termination: SMD/SMT; Military Standard: Not; Composition: Thick Film; Length: 1.6mm; Height: 0.45mm; Width: 0.8mm; Depth: 0.8mm; REACH SVHC: No SVHC; Lead Free: Lead Free; ComponentLink1URL: http://www.farnell.com/datasheets/443971.pdf; ComponentLink1Description: http://www.farnell.com/datasheets/443971.pdf; ComponentLink2URL: http://www.mouser.com/catalog/specsheets/RC0603.pdf; ComponentLink2Description: http://www.mouser.com/catalog/specsheets/RC0603.pdf; Supplier Part Number 1: RC0603JR-0747KL; Supplier 2: Digi-Key; RoHS: Yes; Category: Chip SMD Resistors; Stock 2: 1087850; Pricing 2: 1=0.10000, 10=0.02300, 100=0.00930, 1000=0.00417, 2500=0.00362 (USD); Size Code: 0603; Number of Terminations: 2; Resistor Type: Thick Film; Features: Moisture Resistant; Series: RC; Max Power Dissipation: 100mW; Construction: Rectangular; RoHS Compliant: Yes; ComponentLink3URL: https://datasheet.ciiva.com/46395/443971-46395003.pdf?src-supplier=Element14; ComponentLink3Description: https://datasheet.ciiva.com/46395/443971-46395003.pdf?src-supplier=Element14; ComponentLink4URL: https://datasheet.ciiva.com/12558/rc0603-272842-12558744.pdf?src-supplier=Mouser; ComponentLink4Description: https://datasheet.ciiva.com/12558/rc0603-272842-12558744.pdf?src-supplier=Mouser; Supplier Part Number 2: 311-30.0KHRCT-ND; LCSC Part Number: C127447
R64 = RC0603FR-0710RL: RES SMD 10 OHM 1% 1/10W 0603; Manufacturer: Yageo; Temperature Coefficient: 200ppm/°C; Power Rating: 100mW; Voltage Rating: 50V; Supplier 1: Digi-Key; Manufacturer Part Number: RC0603FR-0710RL; Stock 1: 10836596; Pricing 1: 1=0.1, 10=0.046, 100=0.0187, 1000=0.0084, 2500=0.00729 (USD); Case/Package: 0603; Number of Pins: 2; Case Code (Imperial): 0603; Case Code (Metric): 1608; Contact Plating: Tin,Matte; Min Operating Temperature: -55°C; Max Operating Temperature: 155°C; Resistance: 10R; Tolerance: 1%; Composition: Thick Film; Packaging: Tape and Reel; Voltage Rating (DC): 50V; Termination: SMD/SMT; Military Standard: Not; Length: 1.6mm; Height: 0.45mm; Width: 0.8mm; Depth: 0.8mm; Radiation Hardening: No; Lead Free: Lead Free; REACH SVHC: No SVHC; ComponentLink1URL: http://www.farnell.com/datasheets/1868787.pdf?src-supplier=Element14; ComponentLink1Description: http://www.farnell.com/datasheets/1868787.pdf?src-supplier=Element14; ComponentLink2URL: http://www.yageo.com/documents/recent/PYu-RC0603_51_RoHS_L_4.pdf?src-supplier=Avnet; ComponentLink2Description: http://www.yageo.com/documents/recent/PYu-RC0603_51_RoHS_L_4.pdf?src-supplier=Avnet; ComponentLink3URL: http://documents.rs-components.com/techlib://itc_doclist_GB.htm?stockno=5048984&src-supplier=RSComponents; ComponentLink3Description: http://documents.rs-components.com/techlib://itc_doclist_GB.htm?stockno=5048984&src-supplier=RSComponents; ComponentLink4URL: http://www.yageo.com/documents/recent/PYu-RC0603_51_RoHS_L_4.pdf?src-supplier=Avnet+Europe; ComponentLink4Description: http://www.yageo.com/documents/recent/PYu-RC0603_51_RoHS_L_4.pdf?src-supplier=Avnet+Europe; Supplier Part Number 1: 311-10.0HRDKR-ND; LCSC Part Number: C109318
R66 = AC0603JR-0710KL: RES SMD 10K OHM 5% 1/10W 0603; Manufacturer: Yageo; Voltage Rating: 50V; Resistance: 10kR; Power Rating: 100mW; Temperature Coefficient: 100ppm/°C; Item Type: Resistor; Supplier 1: Future Electronics; Manufacturer Part Number: AC0603JR-0710KL; RoHS: Yes; Category: Chip SMD Resistors; Stock 1: 1533000; Pricing 1: 5000=0.00540 (USD); Case/Package: 0603; Case Code (Imperial): 0603; Case Code (Metric): 1608; Size Code: 0603; Min Operating Temperature: -55°C; Max Operating Temperature: 155°C; Packaging: Tape and Reel; Tolerance: 5%; Package Quantity: 1; Resistor Type: Thick Film; Termination: SMD/SMT; Number of Terminations: 2; Max Power Dissipation: 100mW; Features: Moisture Resistant,Automotive AEC-Q200,Anti-Sulfur; Series: AC; Construction: Rectangular; Length: 0.063inch; Width: 0.031inch; Height: 0.022inch; Depth: 0.8mm; Military Standard: Not; Lead Free: Lead Free; RoHS Compliant: Yes; ComponentLink1URL: https://datasheet.ciiva.com/5562/pyu-ac-51-rohs-l-2-5562553.pdf?src-supplier=Mouser; ComponentLink1Description: https://datasheet.ciiva.com/5562/pyu-ac-51-rohs-l-2-5562553.pdf?src-supplier=Mouser; Supplier Part Number 1: 1029044; LCSC Part Number: C140867
SB1 = Solder Bridge 0603: Solder Bridge ON; Manufacturer Part Number: Solder Bridge; Item Type: Solder Bridge
U7 = SIM7500E: SMD,30x30mm 2G/3G/4G/5G Modules ROHS; Manufacturer: SIMCom; Item Type: IC; Manufacturer Part Number: SIM7500E; Package: SMD,30x30mm; LCSC Part Number: C126259; ComponentLink1Description: LCSC; ComponentLink1URL: https://www.lcsc.com/product-detail/2G-3G-4G-5G-Modules_SIMCom-Wireless-Solutions-SIM7500E_C126259.html
U8 = SMF05CT1G-ES: 15V 5 Unidirectional 5V SOT-363 ESD Protection Devices ROHS; Manufacturer: ElecSuper; Item Type: ESD Diode; Manufacturer Part Number: SMF05CT1G-ES; Package: SOT-363; LCSC Part Number: C5180312; ComponentLink1Description: LCSC; ComponentLink1URL: https://www.lcsc.com/product-detail/ESD-Protection-Devices_ElecSuper-SMF05CT1G-ES_C5180312.html
U10 = SIM-ST-MFF2: GLOBAL IOT EMBEDDED SIM CHIP; Manufacturer: Hologram; Supplier 1: Digi-Key; Manufacturer Part Number: SIM-ST-MFF2; Stock 1: 0; Pricing 1: 1=6.3, 100=5.985 (USD); ComponentLink1URL: https://media.digikey.com/pdf/Data%20Sheets/Hologram%20PDFs/SIM_DS_170107_v2.pdf?src-supplier=Digi-Key; ComponentLink1Description: https://media.digikey.com/pdf/Data%20Sheets/Hologram%20PDFs/SIM_DS_170107_v2.pdf?src-supplier=Digi-Key; Supplier Part Number 1: 1887-1002-1-ND
U11 = FSA2567MPX: IC SWITCH 4PDT 16MLP; Manufacturer: ON Semiconductor / Fairchild; Min Supply Voltage: 2.7V; Max Supply Voltage: 4.3V; Number of Inputs: 4; Number of Outputs: 8; Number of Channels: 1; Max Supply Current: 1uA; Power Dissipation: 500mW; Supply Type: Single; -3db Bandwidth: 475MHz; Supplier 1: Future Electronics; Manufacturer Part Number: FSA2567MPX; RoHS: Yes; Category: Interface ICs; Stock 1: 48000; Pricing 1: 3000=0.375, 6000=0.37, 9000=0.365, 12000=0.36 (USD); Mounting Technology: Surface Mount; Pins: 16; Weight: 0.126g; Min Operating Temperature: -40°C; Max Operating Temperature: 85°C; Packaging: Tape and Reel; Throw Configuration: 4PDT; Series: -; Supply Current: 1uA; Length: 3mm; Width: 3mm; Height: 0.75mm; Radiation Hardening: No; Reach SVHC Compliant: No; Lead Free: Lead Free; RoHS Compliant: Yes; ComponentLink1URL: https://datasheet.ciiva.com/4918/fsa2567-82876-4918495.pdf?src-supplier=Mouser; ComponentLink1Description: https://datasheet.ciiva.com/4918/fsa2567-82876-4918495.pdf?src-supplier=Mouser; ComponentLink2URL: https://datasheet.ciiva.com/17282/fsa2567-17282630.pdf?src-supplier=Future+Electronics; ComponentLink2Description: https://datasheet.ciiva.com/17282/fsa2567-17282630.pdf?src-supplier=Future+Electronics; ComponentLink3URL: https://datasheet.ciiva.com/2979/fsa2567-2979466.pdf?src-supplier=Avnet; ComponentLink3Description: https://datasheet.ciiva.com/2979/fsa2567-2979466.pdf?src-supplier=Avnet; ComponentLink4URL: https://datasheet.ciiva.com/6638/fsa2567-6638602.pdf?src-supplier=Digi-Key; ComponentLink4Description: https://datasheet.ciiva.com/6638/fsa2567-6638602.pdf?src-supplier=Digi-Key; ComponentLink5URL: https://datasheet.ciiva.com/6638/fsa2567-6638634.pdf?src-supplier=Digi-Key; ComponentLink5Description: https://datasheet.ciiva.com/6638/fsa2567-6638634.pdf?src-supplier=Digi-Key; ComponentLink6URL: https://datasheet.ciiva.com/2979/fsa2567-2979467.pdf?src-supplier=Avnet; ComponentLink6Description: https://datasheet.ciiva.com/2979/fsa2567-2979467.pdf?src-supplier=Avnet; Supplier Part Number 1: 9108587; LCSC Part Number: C512961; Item Type: IC
U13 = TXB0102DCUT: IC TRNSLTR BIDIRECTIONAL US8; Manufacturer: Texas Instruments; Propagation Delay: 31ns; Min Supply Voltage: 1.65V; Max Supply Voltage: 5.5V; Data Rate: 100Mbps; Number of Channels: 2; Logic Function: Translator; Turn-On Delay Time: 7.4ns; High Level Output Current: -20uA; Low Level Output Current: 20uA; Output Type: 3-STATE; Output Current: 50mA; Supplier 1: Arrow Electronics; Manufacturer Part Number: TXB0102DCUT; RoHS: Yes; Category: Integrated Circuits (ICs); Stock 1: 10; Pricing 1: 1=0.79330, 10=0.66470, 25=0.65820, 250=0.37450, 500=0.36200, 1000=0.29770, 2500=0.28440 (USD); Mount: Surface Mount; Case/Package: VSSOP; Number of Pins: 8; Weight: 0.000339oz; Contact Plating: Gold; Min Operating Temperature: -40°C; Max Operating Temperature: 85°C; Packaging: Tape and Reel; Package Quantity: 1; Number of Bits: 2; Series: -; Number of Inputs: 2; Length: 2.3mm; Width: 2mm; Height: 0.85mm; Radiation Hardening: No; Lead Free: Lead Free; RoHS Compliant: Yes; REACH SVHC: No SVHC; ComponentLink1URL: https://datasheet.ciiva.com/4226/sces641b-4226901.pdf?src-supplier=Arrow+Electronics; ComponentLink1Description: https://datasheet.ciiva.com/4226/sces641b-4226901.pdf?src-supplier=Arrow+Electronics; ComponentLink2URL: https://datasheet.ciiva.com/15096/getdatasheetpartid-226009-15096242.pdf?src-supplier=Verical; ComponentLink2Description: https://datasheet.ciiva.com/15096/getdatasheetpartid-226009-15096242.pdf?src-supplier=Verical; ComponentLink3URL: https://datasheet.ciiva.com/14287/txb0102-14287498.pdf?src-supplier=Avnet; ComponentLink3Description: https://datasheet.ciiva.com/14287/txb0102-14287498.pdf?src-supplier=Avnet; ComponentLink4URL: https://datasheet.ciiva.com/14287/txb0102-14287370.pdf?src-supplier=Avnet; ComponentLink4Description: https://datasheet.ciiva.com/14287/txb0102-14287370.pdf?src-supplier=Avnet; ComponentLink5URL: https://datasheet.ciiva.com/6619/txb0102-6619255.pdf?src-supplier=Digi-Key; ComponentLink5Description: https://datasheet.ciiva.com/6619/txb0102-6619255.pdf?src-supplier=Digi-Key; ComponentLink6URL: https://datasheet.ciiva.com/6619/txb0102-6619256.pdf?src-supplier=Digi-Key; ComponentLink6Description: https://datasheet.ciiva.com/6619/txb0102-6619256.pdf?src-supplier=Digi-Key; ComponentLink7URL: https://datasheet.ciiva.com/6619/txb0102-6619257.pdf?src-supplier=Digi-Key; ComponentLink7Description: https://datasheet.ciiva.com/6619/txb0102-6619257.pdf?src-supplier=Digi-Key; Supplier Part Number 1: TXB0102DCUT; LCSC Part Number: C2677366; Item Type: IC

## Nets that join several sheets
3V3: Ethernet_Sheet (C19.2 Q2.2 R7.2 R8.2), Power_Sheet (5 pins), Controller_Sheet (21 pins), RS485_RS232_Sheet (13 pins), LEDs_Sheet (Q5.1 R110.1), GPIOs_Expander_Relay_Sheet (11 pins), GSM_Sheet (C46.2 U13.7)
5V: DTMF_Decoder_Sheet (C72.1 U33.11 U33.20), Power_Sheet (11 pins), LEDs_Sheet (9 pins), GPIOs_Expander_Relay_Sheet (6 pins)
5V_USB: Connector_Sheet (FB1.2), Power_Sheet (P2.1 U1.6)
GND: Ethernet_Sheet (37 pins), Connector_Sheet (15 pins), DTMF_Decoder_Sheet (C72.2 U33.5 U33.6 U33.10), Power_Sheet (30 pins), Controller_Sheet (25 pins), RS485_RS232_Sheet (15 pins), LEDs_Sheet (8 pins), GPIOs_Expander_Relay_Sheet (23 pins), GSM_Sheet (56 pins)
GSM_PWR: Power_Sheet (7 pins), GSM_Sheet (9 pins)
USB_VBUS: Connector_Sheet (F5.2), GSM_Sheet (U7.9)
VCC: Connector_Sheet (D18.2 F4.2 R112.1), Power_Sheet (C5.1 C7.1 C8.1 U2.7)
DTMF+: Connector_Sheet (J18.2), DTMF_Decoder_Sheet (C50.2)
DTMF-: Connector_Sheet (J18.1), DTMF_Decoder_Sheet (C51.2)
DTMF_Q1: DTMF_Decoder_Sheet (U33.12), GPIOs_Expander_Relay_Sheet (U15.21)
DTMF_Q2: DTMF_Decoder_Sheet (U33.13), GPIOs_Expander_Relay_Sheet (U15.22)
DTMF_Q3: DTMF_Decoder_Sheet (U33.14), GPIOs_Expander_Relay_Sheet (U15.23)
DTMF_Q4: DTMF_Decoder_Sheet (U33.15), GPIOs_Expander_Relay_Sheet (U15.24)
DTMF_STD: DTMF_Decoder_Sheet (U33.17), Controller_Sheet (P7.1 U4.34)
FAULT: Controller_Sheet (P8.1 U4.31), GPIOs_Expander_Relay_Sheet (U22.4)
GSM_BUCK_EN: Power_Sheet (R54.2 U9.1), GPIOs_Expander_Relay_Sheet (U15.27)
GSM_PROG.GSM_USB_D_N: Connector_Sheet (D3.2 J13.2), GSM_Sheet (U7.7)
GSM_PROG.GSM_USB_D_P: Connector_Sheet (D3.1 J13.3), GSM_Sheet (U7.8)
GSM_PWR_EN: GPIOs_Expander_Relay_Sheet (U15.26), GSM_Sheet (R50.1)
GSM_RST: GPIOs_Expander_Relay_Sheet (U15.25), GSM_Sheet (R47.1)
IN_1: Connector_Sheet (J2.2), GPIOs_Expander_Relay_Sheet (K1.1 K1.6)
IN_2: Connector_Sheet (J3.2), GPIOs_Expander_Relay_Sheet (K2.1 K2.6)
IN_3: Connector_Sheet (J4.2), GPIOs_Expander_Relay_Sheet (K3.1 K3.6)
IN_4: Connector_Sheet (J5.2), GPIOs_Expander_Relay_Sheet (K4.1 K4.6)
INPUT_1: Connector_Sheet (J6.1), GPIOs_Expander_Relay_Sheet (D15.2 F2.2)
INPUT_2: Connector_Sheet (J6.2), GPIOs_Expander_Relay_Sheet (D17.2 F3.2)
INPUT_3: Connector_Sheet (J6.3), GPIOs_Expander_Relay_Sheet (D21.2 F6.2)
INPUT_4: Connector_Sheet (J8.1), GPIOs_Expander_Relay_Sheet (D23.2 F7.2)
INPUT_5: Connector_Sheet (J8.2), GPIOs_Expander_Relay_Sheet (D25.2 F8.2)
INPUT_6: Connector_Sheet (J8.3), GPIOs_Expander_Relay_Sheet (D27.2 F9.2)
INPUT_7: Connector_Sheet (J9.1), GPIOs_Expander_Relay_Sheet (D29.2 F10.2)
INPUT_8: Connector_Sheet (J9.2), GPIOs_Expander_Relay_Sheet (D31.2 F11.2)
IO1: Controller_Sheet (R71.2 U4.19), GPIOs_Expander_Relay_Sheet (U16.4)
IO2: Controller_Sheet (R78.2 U4.20), GPIOs_Expander_Relay_Sheet (U17.4)
IO3: Controller_Sheet (R79.2 U4.21), GPIOs_Expander_Relay_Sheet (U18.4)
IO4: Controller_Sheet (R87.2 U4.22), GPIOs_Expander_Relay_Sheet (U19.4)
IO5: Controller_Sheet (R88.2 U4.8), GPIOs_Expander_Relay_Sheet (U20.4)
IO6: Controller_Sheet (R89.2 U4.23), GPIOs_Expander_Relay_Sheet (U21.4)
IO7: Controller_Sheet (R93.2 U4.25), GPIOs_Expander_Relay_Sheet (U23.4)
IO8: Controller_Sheet (R94.2 U4.24), GPIOs_Expander_Relay_Sheet (U24.4)
LED_DATA: LEDs_Sheet (Q5.2 R110.2), GPIOs_Expander_Relay_Sheet (U15.28)
MCU_RX: Controller_Sheet (U4.28), GSM_Sheet (U13.8)
MCU_TX: Controller_Sheet (U4.29), GSM_Sheet (U13.1)
MUX/ENCRYP_SCL: Controller_Sheet (R62.1 U4.32 U29.6), GPIOs_Expander_Relay_Sheet (U15.12)
MUX/ENCRYP_SDA: Controller_Sheet (R63.1 U4.33 U29.5), GPIOs_Expander_Relay_Sheet (U15.13)
NC_1: Connector_Sheet (J2.1), GPIOs_Expander_Relay_Sheet (K1.4)
NC_2: Connector_Sheet (J3.1), GPIOs_Expander_Relay_Sheet (K2.4)
NC_3: Connector_Sheet (J4.1), GPIOs_Expander_Relay_Sheet (K3.4)
NC_4: Connector_Sheet (J5.1), GPIOs_Expander_Relay_Sheet (K4.4)
NO_1: Connector_Sheet (J2.3), GPIOs_Expander_Relay_Sheet (K1.3)
NO_2: Connector_Sheet (J3.3), GPIOs_Expander_Relay_Sheet (K2.3)
NO_3: Connector_Sheet (J4.3), GPIOs_Expander_Relay_Sheet (K3.3)
NO_4: Connector_Sheet (J5.3), GPIOs_Expander_Relay_Sheet (K4.3)
RE/DE/RS485: Controller_Sheet (U4.9), RS485_RS232_Sheet (R108.2)
RS232_PORT.RS232_RX: Connector_Sheet (J19.2), RS485_RS232_Sheet (F27.1)
RS232_PORT.RS232_TX: Connector_Sheet (J19.1), RS485_RS232_Sheet (F14.1)
RS485_N: Connector_Sheet (J17.2), RS485_RS232_Sheet (F28.2)
RS485_P: Connector_Sheet (J17.1), RS485_RS232_Sheet (F30.2)
RXD/RS485/RS232: Controller_Sheet (U4.10), RS485_RS232_Sheet (R105.2)
TXD/RS485/RS232: Controller_Sheet (U4.11), RS485_RS232_Sheet (R106.2)
W5500_CS: Ethernet_Sheet (U5.32), Controller_Sheet (U4.4)
W5500_INT: Ethernet_Sheet (R14.1 U5.36), Controller_Sheet (U4.12)
W5500_MISO: Ethernet_Sheet (U5.34), Controller_Sheet (U4.6)
W5500_MOSI: Ethernet_Sheet (U5.35), Controller_Sheet (U4.7)
W5500_PWR_EN: Ethernet_Sheet (Q1.1), Controller_Sheet (U4.18)
W5500_RST: Ethernet_Sheet (R16.1 U5.37), Controller_Sheet (U4.17)
W5500_SCLK: Ethernet_Sheet (U5.33), Controller_Sheet (U4.5)